# Altium project ublox_gnss_node.PrjPcb (part 2 of 3)

## Sheet USB_C_GNSS.SchDoc: Ublox GNSS Node
size A4; DocumentNumber: 9; SheetNumber: 9; SheetTotal: 12
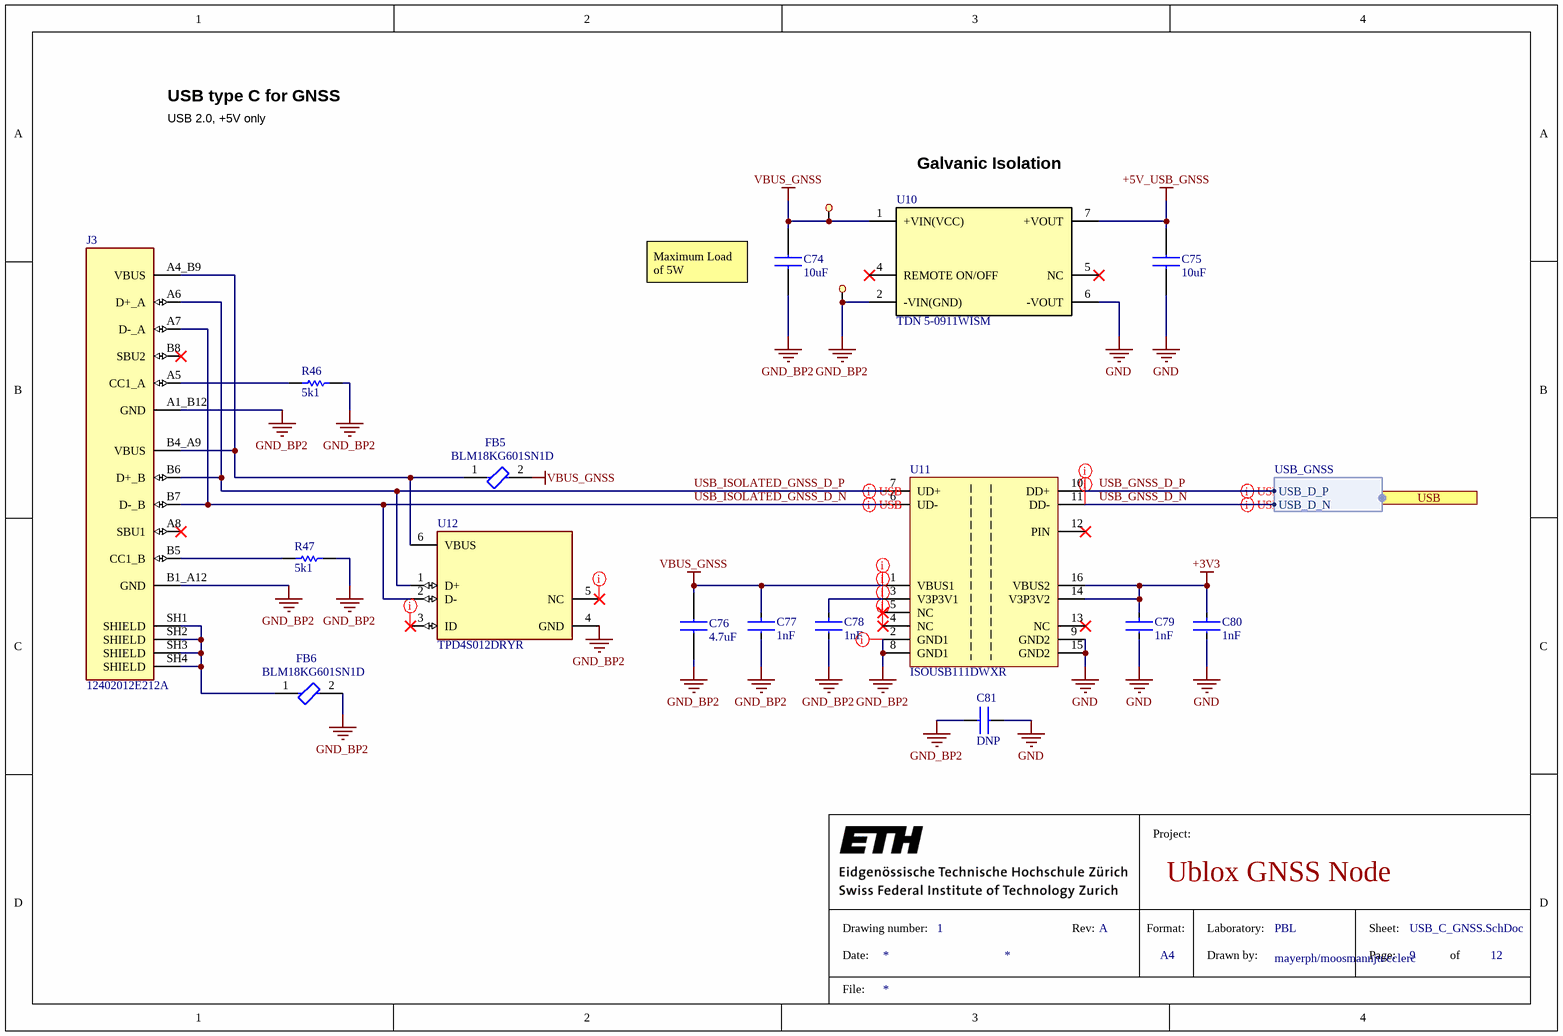
[diagram p4: USB_C_GNSS.SchDoc]

### Parts
*22  testpoint  [testpoint]  (value not drawn)
*24  testpoint  [testpoint]  (value not drawn)
C74  10uF  [CAPC2013X140N]
C75  10uF  [CAPC2013X140N]
C76  4.7uF  [CAPC1608X95N]
C77  1nF  [FP-C0805C-DN-MFG]
C78  1nF  [FP-C0805C-DN-MFG]
C79  1nF  [FP-C0805C-DN-MFG]
C80  1nF  [FP-C0805C-DN-MFG]
C81  DNP  [CAPC3216X180N]
FB5  BLM18KG601SN1D  [FP-BLM18-0_15-t0_8-IPC_A]
FB6  BLM18KG601SN1D  [FP-BLM18-0_15-t0_8-IPC_A]
J3  12402012E212A  [AMPHENOL_12402012E212A]
R46  5k1  [ERJUP6]
R47  5k1  [ERJUP6]
U10  TDN 5-0911WISM  [TDN 5WISM SINGLE_TRP]
U11  ISOUSB111DWXR  [DWX0016A]
U12  TPD4S012DRYR  [FP-DRY0006A-MFG]

### Ports
USB (harness USB_GNSS, see MAIN[6C], GNSS_ZED-X20P[1A])

### Harnesses
USB_GNSS: USB_D_P, USB_D_N

### Nets
+3V3: C79.1 C80.1 U11.14(V3P3V2) U11.16(VBUS2)
+5V_USB_GNSS: C75.2 U10.7(+VOUT)
GND: C75.1 C79.2 C80.2 C81.1 U10.6(-VOUT) U11.9(GND2) U11.15(GND2)
GND_BP2: *24.1 C74.1 C76.1 C77.2 C78.2 C81.2 FB6.2 J3.A1_B12(GND) J3.B1_A12(GND) R46.1 R47.1 U10.2(-VIN(GND)) U11.2(GND1) U11.8(GND1) U12.4(GND)
VBUS_GNSS: *22.1 C74.2 C76.2 C77.1 FB5.2 U10.1(+VIN(VCC)) U11.1(VBUS1)
USB_GNSS_D_N: U11.11(DD-) ; port USB.USB_D_N  [project net USB_D_N]
USB_GNSS_D_P: U11.10(DD+) ; port USB.USB_D_P  [project net USB_D_P]
USB_ISOLATED_GNSS_D_N: J3.A7(D-_A) J3.B7(D-_B) U11.6(UD-) U12.2(D-)
USB_ISOLATED_GNSS_D_P: J3.A6(D+_A) J3.B6(D+_B) U11.7(UD+) U12.1(D+)
NetC78_1: C78.1 U11.3(V3P3V1)
NetFB5_1: FB5.1 J3.A4_B9(VBUS) J3.B4_A9(VBUS) U12.6(VBUS)
NetFB6_1: FB6.1 J3.SH1(SHIELD) J3.SH2(SHIELD) J3.SH3(SHIELD) J3.SH4(SHIELD)
NetJ3_A5: J3.A5(CC1_A) R46.2
NetJ3_B5: J3.B5(CC1_B) R47.2

Not connected (* = marked no-connect by the designer): J3 A8(SBU1)* B8(SBU2)*; U10 4(REMOTE_ON/OFF)* 5(NC)*; U11 4(NC)* 5(NC)* 12(PIN)* 13(NC)*; U12 3(ID)* 5(NC)*

### Layout directives
net class USB_isolated: NetC78_1, NetU11_4, NetU11_5, NetU12_3, NetU12_5, VBUS_GNSS
mark named USB: GND_BP2
net class D90: USB_D_N, USB_D_P
differential pair; differential pair class USB_90R_isolated; rule Matched Net Lengths [Tolerance = 100mil]; net class USB_90R_isolated: USB_ISOLATED_GNSS_D_N, USB_ISOLATED_GNSS_D_P
differential pair; differential pair class USB_90R; rule Matched Net Lengths [Tolerance = 100mil]; net class USB_90R: USB_D_N, USB_D_P

### Notes on the sheet
- USB type C for GNSS
- USB 2.0, +5V only
- (near U10) Galvanic Isolation
- (near C74) Maximum Load of 5W
- Project:
- Drawing number:
- Date:
- 1
- Rev:
- Format:
- A4
- Laboratory:
- Drawn by:
- Sheet:
- Page:
- of
- File:

### Library data of the parts
C74 C75 = LMK212AB7106MG-T: Capacitor 10uF 0805; Manufacturer_Name: TAIYO YUDEN; Datasheet Link: https://datasheet.datasheetarchive.com/originals/distributors/Datasheets-DGA20/25674.pdf; Height: 1.4mm; Mouser Part Number: 963-LMK212AB7106MG-T; Mouser Price/Stock: https://www.mouser.co.uk/ProductDetail/Taiyo-Yuden/LMK212AB7106MG-T?qs=CNQs48zzdnrud19jlu61Cg%3D%3D; Manufacturer Part Number: LMK212AB7106MG-T; Supplier 1: Digikey; Supplier Part Number 1: 587-3417-1-ND
C76 = CL10B475KQ8NQNC: Capacitor 4.7uF 0603; Manufacturer_Name: SAMSUNG; Datasheet Link: https://datasheet.datasheetarchive.com/originals/distributors/Datasheets-DGA10/2410603.pdf; Height: 0.95mm; Manufacturer Part Number: CL10B475KQ8NQNC; Mouser Part Number: 187-CL10B475KQ8NQNC; Mouser Price/Stock: https://www.mouser.co.uk/ProductDetail/Samsung-Electro-Mechanics/CL10B475KQ8NQNC?qs=6tbHoouHnQxd6rcaSwpT7Q%3D%3D; Arrow Part Number: CL10B475KQ8NQNC; Arrow Price/Stock: https://www.arrow.com/en/products/cl10b475kq8nqnc/samsung-electro-mechanics; Supplier 1: Digikey; Supplier Part Number 1: 1276-2087-1-ND
C77-C80 = CMP-2007-00235-2: Capacitor 1nF 0805; Manufacturer: KEMET; Manufacturer Part Number: C0805C102J5GACTU; Value: 1,000 pF; Voltage Rating: 50 V; Temperature Characteristic: C0G; Material: Ceramic; Temperature Coefficient: 30ppm/°C; Tolerance: 0.05; Automotive: No; Device Class L1: Passive Components; Digikey Description: CAP CER 1000PF 50V C0G/NP0 0805; Lead Free: Yes; Capacitance: 1,000 pF; Package: C0805C-DN; RoHS: TRUE; Temperature Range High: +125°C; Height: 0.88mm; Ipc Land Pattern Name: CAPC200125X78; Category: Cap; ComponentLink2URL: https://content.kemet.com/datasheets/KEM_C1003_C0G_SMD.pdf; Device Class L2: Capacitors; ComponentLink2Description: Datasheet; Temperature: -55°C to +125°C; Octopart: https://octopart.com/c0805c102j5gactu-kemet-97757; Mouser Description: Multilayer Ceramic Capacitors MLCC - SMD/SMT 50volts 1000pF C0G 5%; Device Class L3: Ceramic Capacitors; Temperature Range Low: -55°C; Supplier 1: Mouser; Supplier Part Number 1: 80-C0805C102J5G
C81 = CL31B102KJHNNNE: Capacitor 1nF/2kV 3216 Isolated GND Loop Cap; Manufacturer_Name: SAMSUNG; Datasheet Link: https://www.tme.com/Document/4a42202b32dab16128fe107dd69598cc/samsung-chip-cap.pdf; Height: 1.8mm; Manufacturer Part Number: CL31B102KJHNNNE; Mouser Part Number: 187-CL31B102KJHNNNE; Mouser Price/Stock: https://www.mouser.co.uk/ProductDetail/Samsung-Electro-Mechanics/CL31B102KJHNNNE?qs=X6jEic%2FHinAYVHtIjHgytw%3D%3D; Arrow Part Number: CL31B102KJHNNNE; Arrow Price/Stock: https://www.arrow.com/en/products/cl31b102kjhnnne/samsung-electro-mechanics?utm_currency=USD&region=nac; Supplier 1: DigiKey; Supplier Part Number 1: 1276-3073-1-ND
FB5 FB6 = CMP-0686-00581-3: Chip Ferrite Bead, 0603, 600Ω @ 100MHz, 0.15Ω, 25%, 1.3A; Material: Steel; Number of Lines: 1; Impedance: 600R; DC Resistance (DCR): 150mR; Tolerance: 25%; Case Code (Metric): 1608; Width: 0.8mm; DC Current: 1.3A; Max DC Current: 1.3A; Package Quantity: 1; Number of Pins: 2; Military Standard: Not; RoHS Compliant: Yes; Termination: SMD/SMT; Max Operating Temperature: 125°C; Length: 1.6mm; Depth: 0.8mm; Case Code (Imperial): 0603; Series: BLM18K; Inductor Type: FERRITE BEAD; Core Material: Ferrite; Number of Circuits: 1; Height: 0.8mm; Case/Package: 0603; REACH SVHC: No SVHC; Packaging: Tape and Reel; Min Operating Temperature: -55°C; Max Current Rating: 1.3A; Radiation Hardening: No; Current Rating: 1.3A; Lead Free: Lead Free; Test Frequency: 100MHz; Weight: 7.1E-05oz
J3 = 12402012E212A: USB2.0, Type C, Top mount, CH 1.68mm, Dual Row SMT; MF: Amphenol ICC (Commercial Products); MP: 12402012E212A; Price: None; Package: None; Availability: In Stock; SnapEDA_Link: https://www.snapeda.com/parts/12402012E212A/Amphenol/view-part/?ref=snap; Value: *; Check_prices: https://www.snapeda.com/parts/12402012E212A/Amphenol/view-part/?ref=eda; Purchase-URL: https://pricing.snapeda.com/search/part/12402012E212A/?ref=eda; Manufacturer Part Number: 12402012E212A; Supplier 1: Digikey; Supplier Part Number 1: 664-12402012E212ACT-ND
R46 R47 = ERJ-UP6D5101V: Resistor 5k1 0805; Manufacturer_Name: Panasonic; Datasheet Link: https://industrial.panasonic.com/cdbs/www-data/pdf/RDP0000/AOA0000C337.pdf; Height: 0.7mm; Mouser Part Number: 667-ERJ-UP6D5101V; Mouser Price/Stock: https://www.mouser.co.uk/ProductDetail/Panasonic/ERJ-UP6D5101V?qs=ZcfC38r4Pouz7%2FLHthUDHQ%3D%3D; Arrow Part Number: ERJ-UP6D5101V; Arrow Price/Stock: https://www.arrow.com/en/products/erj-up6d5101v/panasonic?utm_currency=USD&region=nac; Supplier 1: Mouser; Supplier Part Number 1: 667-ERJ-UP6D5101V; Manufacturer Part Number: ERJ-UP6D5101V
U10 = TDN 5-0911WISM: TDN 5-0911WISM DC-DC Converter, 5V, 1A; No. of Outputs: 1 Output; Output Power Max: 5W; Voltage - 1: 5V; Current 1: 1A;; NexarPartId: 76519263; Number of Outputs: 1; RoHS: Compliant; Output Power: 5W; Width: 9.1mm; Height: 10.2mm; Supplier: DigiKey; Supplier Part Number: TDN5-0911WISM-ND
U11 = ISOUSB111DWXR: Low emissions, full and low speed isolated USB repeater 16-SSOP -40 to 125; Manufacturer: Texas Instruments; Supplier: Digikey; Supplier Part Number: 296-ISOUSB111DWXRCT-ND; Manufacturer Part Number: ISOUSB111DWXR; RoHS: No; Stock: 317; Pricing: 1=10.29, 10=9.294, 25=8.8616, 100=7.6946, 250=7.34876, 500=6.70034 (USD); Supplier 1: Digikey; Supplier Part Number 1: 296-ISOUSB111DWXRCT-ND
U12 = CMP-0326-00038-4: TVS DIODE 5.5V 6SON; Breakdown Voltage: 24V; Interface: USB; ESD Protection: Yes; Peak Pulse Power: 60W; Number of Circuits: 4; Polarity: Unidirectional; Capacitance: 15pF; Test Current: 1mA; Working Voltage: 19V; Min Breakdown Voltage: 6V; Peak Pulse Current: 3A; Operating Supply Voltage: 950mV; Max Operating Temperature: 85°C; Packaging: Tape and Reel; Termination: SMD/SMT; Number of Pins: 6; Radiation Hardening: No; Width: 1.05mm; REACH SVHC: No SVHC; Lead Free: Lead Free; Depth: 1mm; Package Quantity: 5000; Length: 1.45mm; Direction: Unidirectional; Min Operating Temperature: -40°C; Number of Channels: 4; Max Power Dissipation: 60W; Height: 0.55mm; Manufacturer Part Number: TPD4S012DRYR

## Sheet USB_C_MCU.SchDoc: Ublox GNSS Node
size A4; DocumentNumber: 8; SheetNumber: 8; SheetTotal: 12
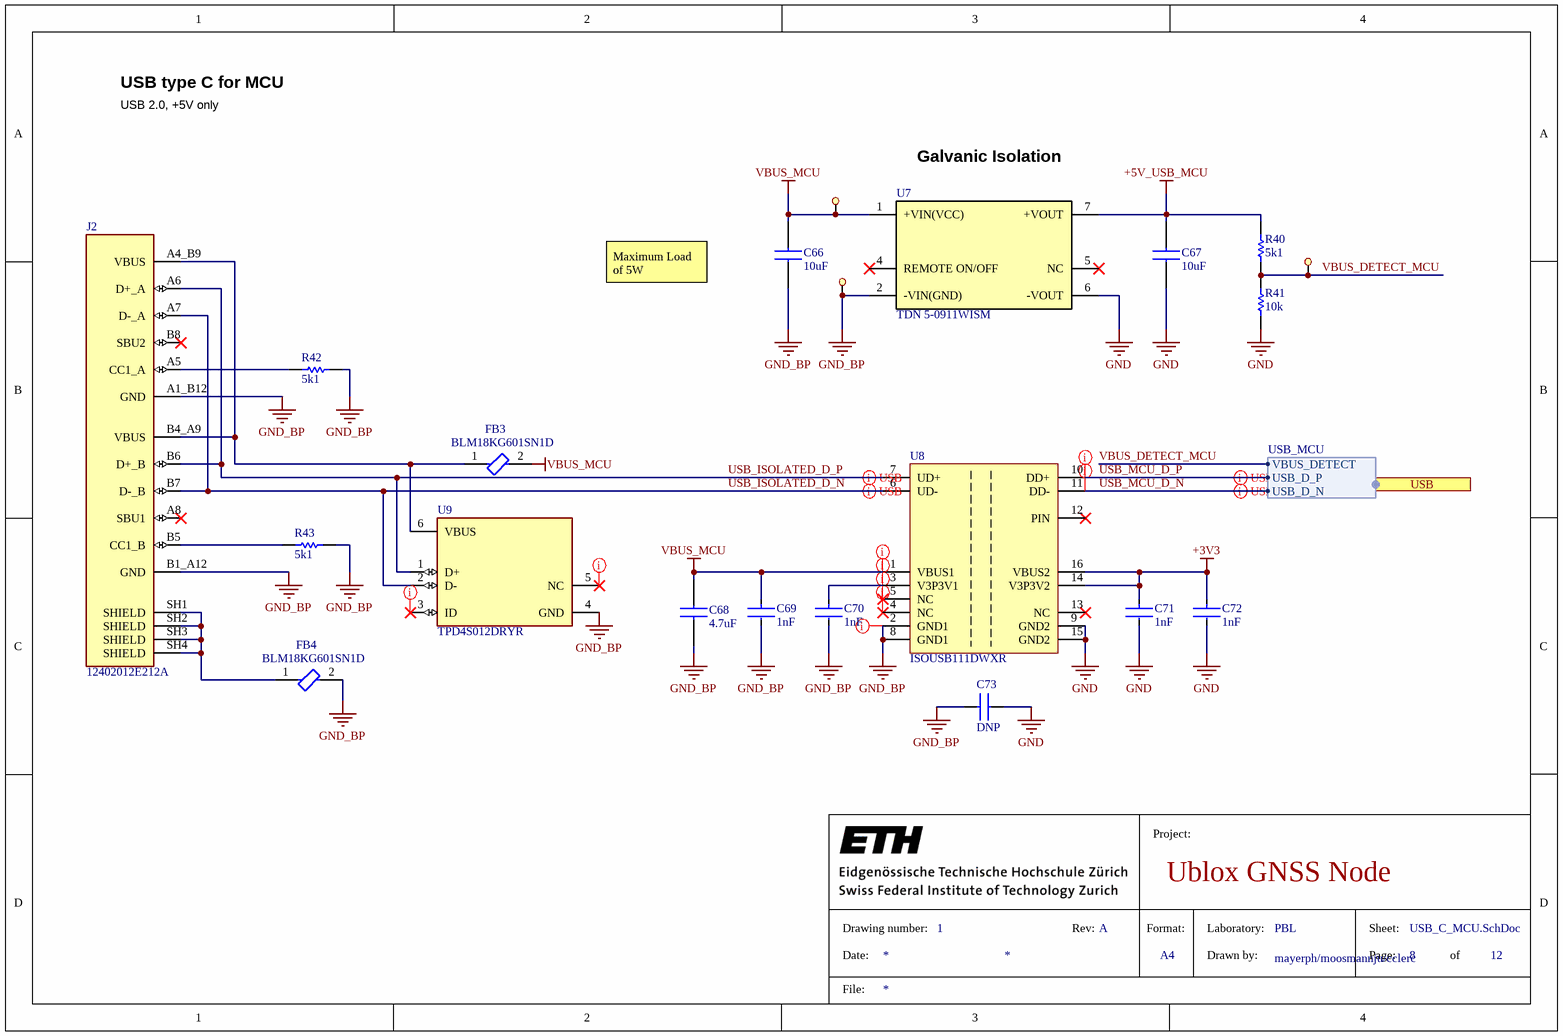
[diagram p5: USB_C_MCU.SchDoc]

### Parts
*19  testpoint  [testpoint]  (value not drawn)
*20  testpoint  [testpoint]  (value not drawn)
*21  testpoint  [testpoint]  (value not drawn)
C66  10uF  [CAPC2013X140N]
C67  10uF  [CAPC2013X140N]
C68  4.7uF  [CAPC1608X95N]
C69  1nF  [FP-C0805C-DN-MFG]
C70  1nF  [FP-C0805C-DN-MFG]
C71  1nF  [FP-C0805C-DN-MFG]
C72  1nF  [FP-C0805C-DN-MFG]
C73  DNP  [CAPC3216X180N]
FB3  BLM18KG601SN1D  [FP-BLM18-0_15-t0_8-IPC_A]
FB4  BLM18KG601SN1D  [FP-BLM18-0_15-t0_8-IPC_A]
J2  12402012E212A  [AMPHENOL_12402012E212A]
R40  5k1  [ERJUP6]
R41  10k  [RESC1005X40X25ML05T05]
R42  5k1  [ERJUP6]
R43  5k1  [ERJUP6]
U7  TDN 5-0911WISM  [TDN 5WISM SINGLE_TRP]
U8  ISOUSB111DWXR  [DWX0016A]
U9  TPD4S012DRYR  [FP-DRY0006A-MFG]

### Ports
USB (harness USB_MCU, see MAIN[6C], MCU[1A])

### Harnesses
USB_MCU: USB_D_P, USB_D_N, VBUS_DETECT

### Nets
+3V3: C71.1 C72.1 U8.14(V3P3V2) U8.16(VBUS2)
+5V_USB_MCU: C67.2 R40.1 U7.7(+VOUT)
GND: C67.1 C71.2 C72.2 C73.1 R41.1 U7.6(-VOUT) U8.9(GND2) U8.15(GND2)
GND_BP: *21.1 C66.1 C68.1 C69.2 C70.2 C73.2 FB4.2 J2.A1_B12(GND) J2.B1_A12(GND) R42.1 R43.1 U7.2(-VIN(GND)) U8.2(GND1) U8.8(GND1) U9.4(GND)
VBUS_MCU: *19.1 C66.2 C68.2 C69.1 FB3.2 U7.1(+VIN(VCC)) U8.1(VBUS1)
USB_ISOLATED_D_N: J2.A7(D-_A) J2.B7(D-_B) U8.6(UD-) U9.2(D-)
USB_ISOLATED_D_P: J2.A6(D+_A) J2.B6(D+_B) U8.7(UD+) U9.1(D+)
USB_MCU_D_N: U8.11(DD-) ; port USB.USB_D_N
USB_MCU_D_P: U8.10(DD+) ; port USB.USB_D_P
VBUS_DETECT_MCU: *20.1 R40.2 R41.2 ; port USB.VBUS_DETECT
NetC70_1: C70.1 U8.3(V3P3V1)
NetFB3_1: FB3.1 J2.A4_B9(VBUS) J2.B4_A9(VBUS) U9.6(VBUS)
NetFB4_1: FB4.1 J2.SH1(SHIELD) J2.SH2(SHIELD) J2.SH3(SHIELD) J2.SH4(SHIELD)
NetJ2_A5: J2.A5(CC1_A) R42.2
NetJ2_B5: J2.B5(CC1_B) R43.2

Not connected (* = marked no-connect by the designer): J2 A8(SBU1)* B8(SBU2)*; U7 4(REMOTE_ON/OFF)* 5(NC)*; U8 4(NC)* 5(NC)* 12(PIN)* 13(NC)*; U9 3(ID)* 5(NC)*

### Layout directives
net class USB_isolated: NetC70_1, NetU8_4, NetU8_5, NetU9_3, NetU9_5, VBUS_MCU
mark named USB: GND_BP
net class D90: USB_MCU_D_N, USB_MCU_D_P
differential pair; differential pair class USB_90R_isolated; rule Matched Net Lengths [Tolerance = 100mil]; net class USB_90R_isolated: USB_ISOLATED_D_N, USB_ISOLATED_D_P
differential pair; differential pair class USB_90R; rule Matched Net Lengths [Tolerance = 100mil]; net class USB_90R: USB_MCU_D_N, USB_MCU_D_P

### Notes on the sheet
- USB type C for MCU
- USB 2.0, +5V only
- (near U7) Galvanic Isolation
- Maximum Load of 5W
- Project:
- Drawing number:
- Date:
- 1
- Rev:
- Format:
- A4
- Laboratory:
- Drawn by:
- Sheet:
- Page:
- of
- File:

### Library data of the parts
C66 C67 = LMK212AB7106MG-T: as C74 on sheet USB_C_GNSS; Datasheet Link: https://datasheet.datasheetarchive.com/originals/distributors/Datasheets-DGA20/25674.pdf; Height: 1.4mm; Mouser Part Number: 963-LMK212AB7106MG-T; Mouser Price/Stock: https://www.mouser.co.uk/ProductDetail/Taiyo-Yuden/LMK212AB7106MG-T?qs=CNQs48zzdnrud19jlu61Cg%3D%3D; Manufacturer Part Number: LMK212AB7106MG-T; Supplier 1: Digikey; Supplier Part Number 1: 587-3417-1-ND
C68 = CL10B475KQ8NQNC: as C76 on sheet USB_C_GNSS; Datasheet Link: https://datasheet.datasheetarchive.com/originals/distributors/Datasheets-DGA10/2410603.pdf; Height: 0.95mm; Manufacturer Part Number: CL10B475KQ8NQNC; Mouser Part Number: 187-CL10B475KQ8NQNC; Mouser Price/Stock: https://www.mouser.co.uk/ProductDetail/Samsung-Electro-Mechanics/CL10B475KQ8NQNC?qs=6tbHoouHnQxd6rcaSwpT7Q%3D%3D; Arrow Part Number: CL10B475KQ8NQNC; Arrow Price/Stock: https://www.arrow.com/en/products/cl10b475kq8nqnc/samsung-electro-mechanics; Supplier 1: Digikey; Supplier Part Number 1: 1276-2087-1-ND
C69-C72 = CMP-2007-00235-2: as C77 on sheet USB_C_GNSS; Automotive: No; Device Class L1: Passive Components; Digikey Description: CAP CER 1000PF 50V C0G/NP0 0805; Lead Free: Yes; Capacitance: 1,000 pF; Package: C0805C-DN; RoHS: TRUE; Temperature Range High: +125°C; Height: 0.88mm; Ipc Land Pattern Name: CAPC200125X78; Category: Cap; ComponentLink2URL: https://content.kemet.com/datasheets/KEM_C1003_C0G_SMD.pdf; Device Class L2: Capacitors; ComponentLink2Description: Datasheet; Temperature: -55°C to +125°C; Octopart: https://octopart.com/c0805c102j5gactu-kemet-97757; Mouser Description: Multilayer Ceramic Capacitors MLCC - SMD/SMT 50volts 1000pF C0G 5%; Device Class L3: Ceramic Capacitors; Temperature Range Low: -55°C; Supplier 1: Mouser; Supplier Part Number 1: 80-C0805C102J5G
C73 = CL31B102KJHNNNE: as C81 on sheet USB_C_GNSS; Datasheet Link: https://www.tme.com/Document/4a42202b32dab16128fe107dd69598cc/samsung-chip-cap.pdf; Height: 1.8mm; Manufacturer Part Number: CL31B102KJHNNNE; Mouser Part Number: 187-CL31B102KJHNNNE; Mouser Price/Stock: https://www.mouser.co.uk/ProductDetail/Samsung-Electro-Mechanics/CL31B102KJHNNNE?qs=X6jEic%2FHinAYVHtIjHgytw%3D%3D; Arrow Part Number: CL31B102KJHNNNE; Arrow Price/Stock: https://www.arrow.com/en/products/cl31b102kjhnnne/samsung-electro-mechanics?utm_currency=USD&region=nac; Supplier 1: DigiKey; Supplier Part Number 1: 1276-3073-1-ND
FB3 FB4 = CMP-0686-00581-3: as FB5 on sheet USB_C_GNSS; Tolerance: 25%; Case Code (Metric): 1608; Width: 0.8mm; DC Current: 1.3A; Max DC Current: 1.3A; Package Quantity: 1; Number of Pins: 2; Military Standard: Not; RoHS Compliant: Yes; Termination: SMD/SMT; Max Operating Temperature: 125°C; Length: 1.6mm; Depth: 0.8mm; Case Code (Imperial): 0603; Series: BLM18K; Inductor Type: FERRITE BEAD; Core Material: Ferrite; Number of Circuits: 1; Height: 0.8mm; Case/Package: 0603; REACH SVHC: No SVHC; Packaging: Tape and Reel; Min Operating Temperature: -55°C; Max Current Rating: 1.3A; Radiation Hardening: No; Current Rating: 1.3A; Lead Free: Lead Free; Test Frequency: 100MHz; Weight: 7.1E-05oz
J2 = 12402012E212A: as J3 on sheet USB_C_GNSS; MP: 12402012E212A; Price: None; Package: None; Availability: In Stock; SnapEDA_Link: https://www.snapeda.com/parts/12402012E212A/Amphenol/view-part/?ref=snap; Value: *; Check_prices: https://www.snapeda.com/parts/12402012E212A/Amphenol/view-part/?ref=eda; Purchase-URL: https://pricing.snapeda.com/search/part/12402012E212A/?ref=eda; Manufacturer Part Number: 12402012E212A; Supplier 1: Digikey; Supplier Part Number 1: 664-12402012E212ACT-ND
R40 R42 R43 = ERJ-UP6D5101V: as R46 on sheet USB_C_GNSS; Datasheet Link: https://industrial.panasonic.com/cdbs/www-data/pdf/RDP0000/AOA0000C337.pdf; Height: 0.7mm; Mouser Part Number: 667-ERJ-UP6D5101V; Mouser Price/Stock: https://www.mouser.co.uk/ProductDetail/Panasonic/ERJ-UP6D5101V?qs=ZcfC38r4Pouz7%2FLHthUDHQ%3D%3D; Arrow Part Number: ERJ-UP6D5101V; Arrow Price/Stock: https://www.arrow.com/en/products/erj-up6d5101v/panasonic?utm_currency=USD&region=nac; Supplier 1: Mouser; Supplier Part Number 1: 667-ERJ-UP6D5101V; Manufacturer Part Number: ERJ-UP6D5101V
R41 = CMP-2002-00433-1: Resistor 10k 0402; Manufacturer Part Number: ERJ-2GEJ103X; Manufacturer: Panasonic; Supplier 1: Mouser; Supplier Part Number 1: 667-ERJ-2GEJ103X
U7 = TDN 5-0911WISM: as U10 on sheet USB_C_GNSS; RoHS: Compliant; Output Power: 5W; Width: 9.1mm; Height: 10.2mm; Supplier: DigiKey; Supplier Part Number: TDN5-0911WISM-ND
U8 = ISOUSB111DWXR: as U11 on sheet USB_C_GNSS; Supplier: Digikey; Supplier Part Number: 296-ISOUSB111DWXRCT-ND; Manufacturer Part Number: ISOUSB111DWXR; RoHS: No; Stock: 317; Pricing: 1=10.29, 10=9.294, 25=8.8616, 100=7.6946, 250=7.34876, 500=6.70034 (USD); Supplier 1: Digikey; Supplier Part Number 1: 296-ISOUSB111DWXRCT-ND
U9 = CMP-0326-00038-4: as U12 on sheet USB_C_GNSS; Max Operating Temperature: 85°C; Packaging: Tape and Reel; Termination: SMD/SMT; Number of Pins: 6; Radiation Hardening: No; Width: 1.05mm; REACH SVHC: No SVHC; Lead Free: Lead Free; Depth: 1mm; Package Quantity: 5000; Length: 1.45mm; Direction: Unidirectional; Min Operating Temperature: -40°C; Number of Channels: 4; Max Power Dissipation: 60W; Height: 0.55mm; Manufacturer Part Number: TPD4S012DRYR

## Sheet ETH.SchDoc: Ublox GNSS Node
size A3; DocumentNumber: 6; SheetNumber: 6; SheetTotal: 12
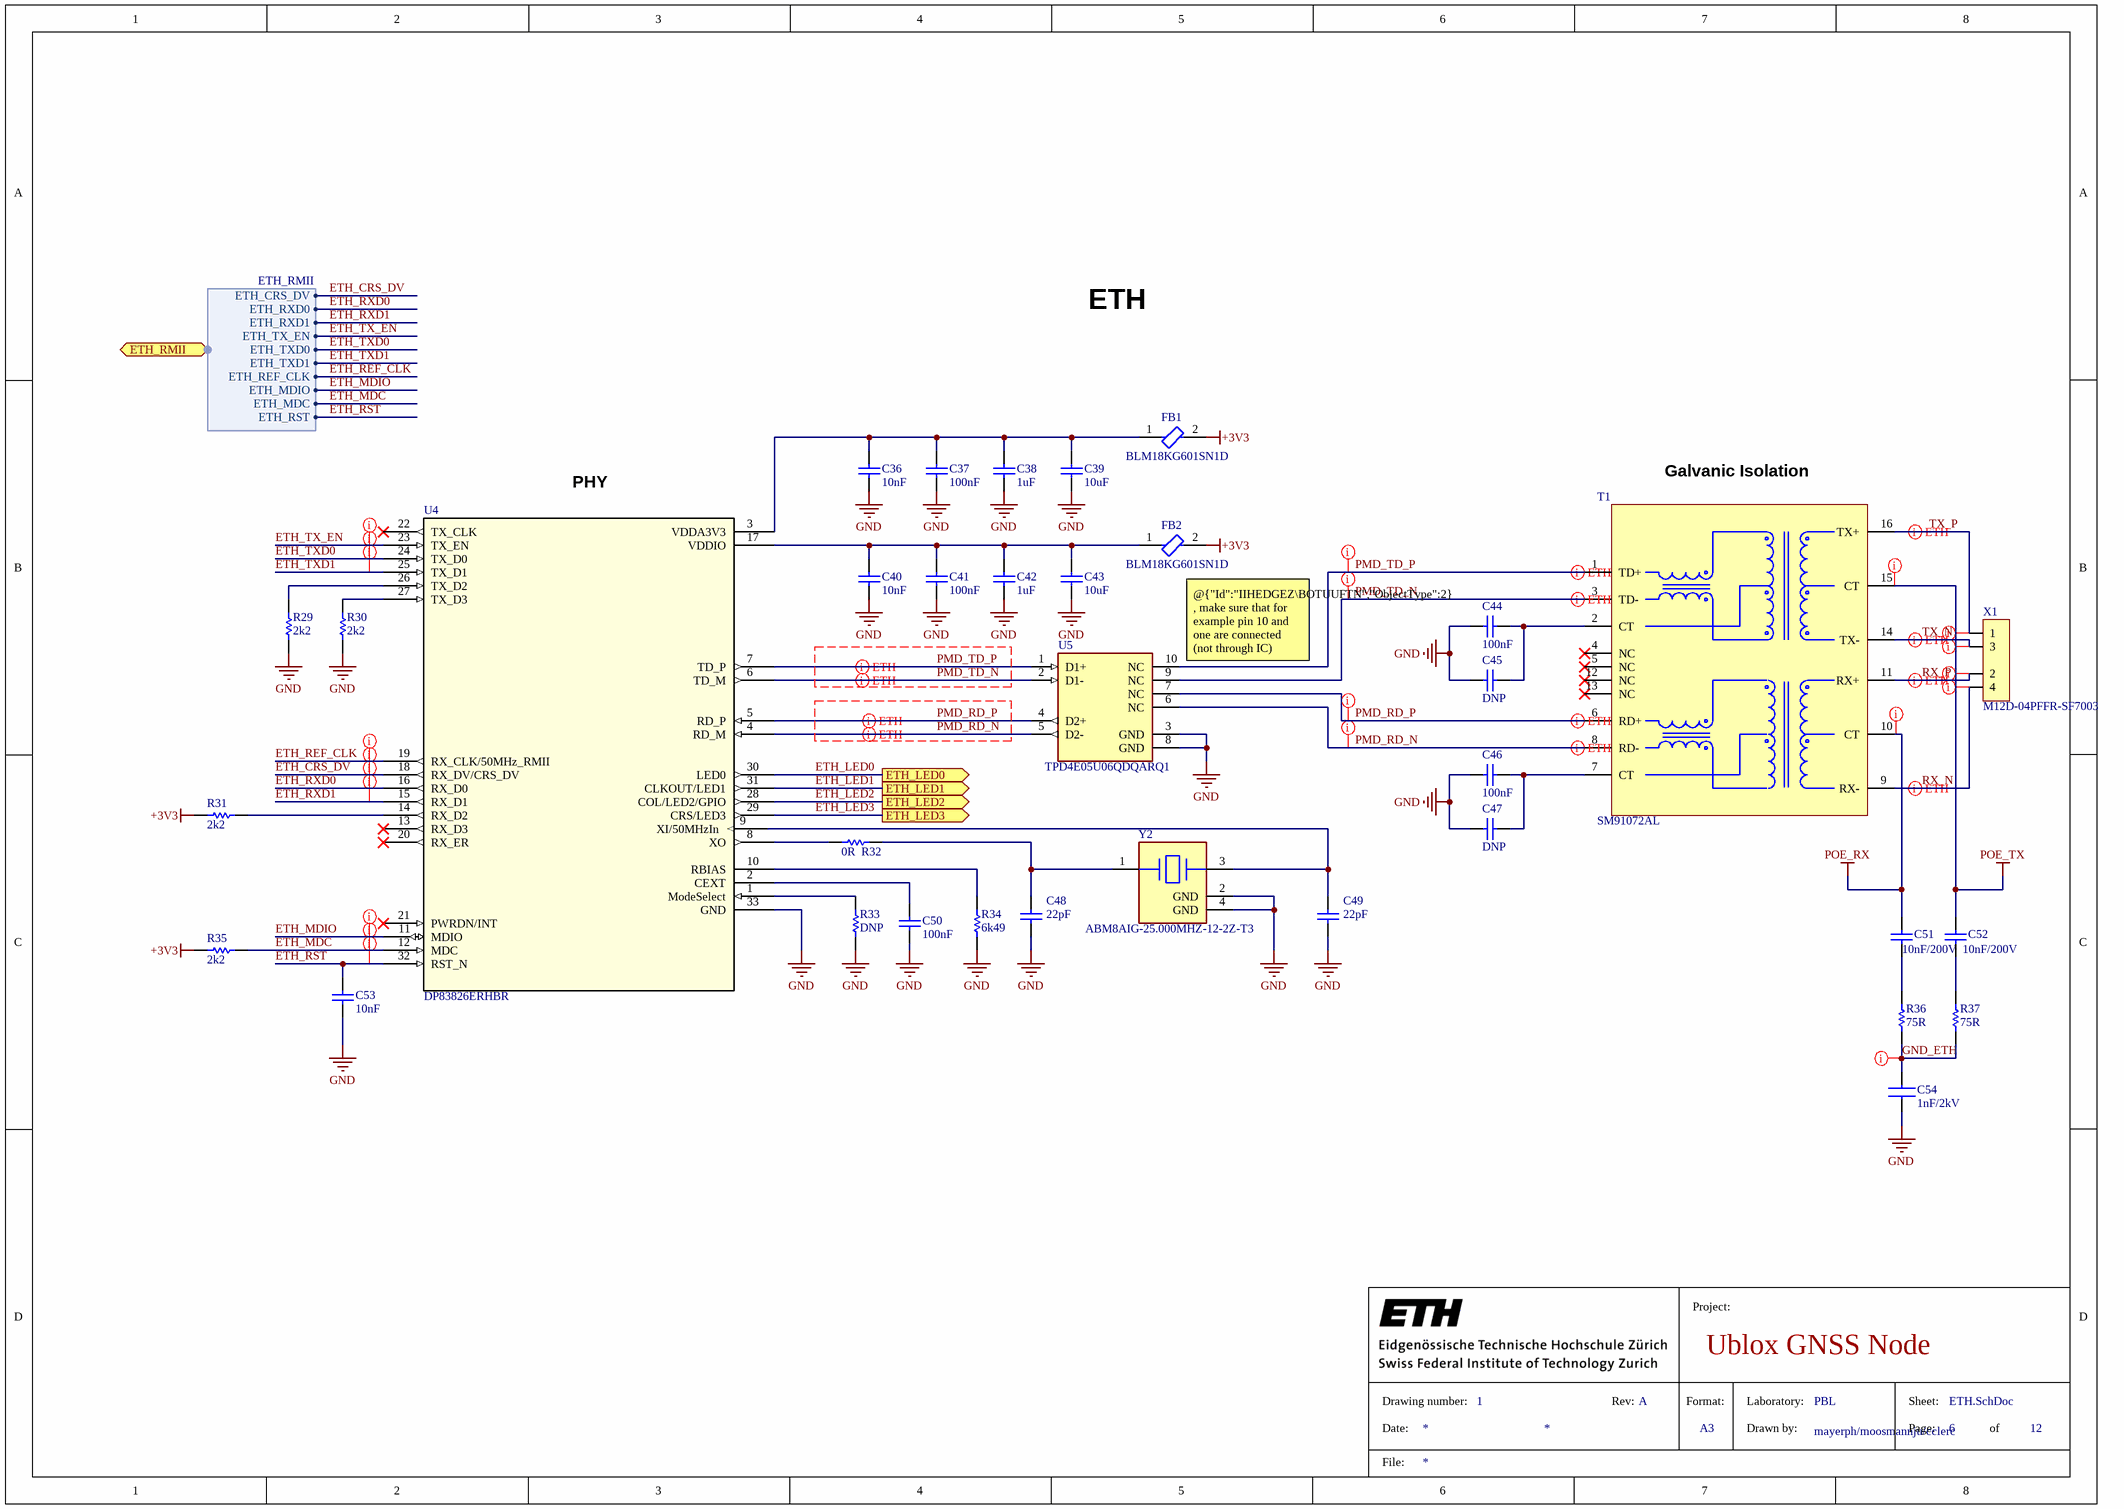
[diagram p6: ETH.SchDoc]

### Parts
C36  10nF  [GRM15x]
C37  100nF  [CAPC1005X55X25LL05T10]
C38  1uF  [CAPC1005X70N]
C39  10uF  [GRM15x]
C40  10nF  [GRM15x]
C41  100nF  [CAPC1005X55X25LL05T10]
C42  1uF  [CAPC1005X70N]
C43  10uF  [GRM15x]
C44  100nF  [CAPC1005X55X25LL05T10]
C45  DNP  [CAPC1005X55X25LL05T10]
C46  100nF  [CAPC1005X55X25LL05T10]
C47  DNP  [CAPC1005X55X25LL05T10]
C48  22pF  [C0402C104J4RACTU]
C49  22pF  [C0402C104J4RACTU]
C50  100nF  [CAPC1005X55X25LL05T10]
C51  10nF/200V  [CAPC0603(1608)100_L]
C52  10nF/200V  [CAPC0603(1608)100_L]
C53  10nF  [GRM15x]
C54  1nF/2kV  [CAPC3216X180N]
FB1  BLM18KG601SN1D  [FP-BLM18-0_15-t0_8-IPC_A]
FB2  BLM18KG601SN1D  [FP-BLM18-0_15-t0_8-IPC_A]
R29  2k2  [RESC2013X60X40LL20T25]
R30  2k2  [RESC2013X60X40LL20T25]
R31  2k2  [RESC2013X60X40LL20T25]
R32  0R  [RESC1005X40X25NL05T10]
R33  DNP  [RESC1005X40X25NL05T10]
R34  6k49  [RESC1005X40X25NL05T05]
R35  2k2  [RESC2013X60X40LL20T25]
R36  75R  [RESC2013X60X40NL20T25]
R37  75R  [RESC2013X60X40NL20T25]
T1  SM91072AL  [SOIC127P950X590-16N]
U4  DP83826ERHBR  [QFN_ERHBR_TEX]
U5  TPD4E05U06QDQARQ1  [FP-DQA0010A-MFG]
X1  M12D-04PFFR-SF7003  [M12D04PFFRSF7003]
Y2  ABM8AIG-25.000MHZ-12-2Z-T3  [FP-ABM8AIG-MFG]

### Ports
ETH_LED0 (out, see MAIN[3C], IndicatorLEDs[1A]), ETH_LED1 (out, see MAIN[3C], IndicatorLEDs[1A]), ETH_LED2 (out, see MAIN[3C], IndicatorLEDs[1B]), ETH_LED3 (out, see MAIN[3C], IndicatorLEDs[1B]), ETH_RMII (bidir, harness ETH_RMII, see MAIN[3C], MCU[1A])

### Harnesses
ETH_RMII: ETH_REF_CLK, ETH_MDIO, ETH_MDC, ETH_CRS_DV, ETH_TX_EN, ETH_RXD0, ETH_RXD1, ETH_TXD0, ETH_TXD1, ETH_RST

### Nets
+3V3: FB1.2 FB2.2 R31.1 R35.2
GND: C36.1 C37.1 C38.1 C39.1 C40.1 C41.1 C42.1 C43.1 C44.1 C45.1 C46.1 C47.1 C48.1 C49.1 C50.1 C53.1 C54.1 R29.1 R30.1 R33.1 R34.1 U4.33(GND) U5.3(GND) U5.8(GND) Y2.2(GND) Y2.4(GND)
POE_RX: C51.1 T1.10(CT)
POE_TX: C52.1 T1.15(CT)
ETH_CRS_DV: U4.18(RX_DV/CRS_DV) ; port ETH_RMII.ETH_CRS_DV
ETH_LED0: U4.30(LED0) ; port ETH_LED0
ETH_LED1: U4.31(CLKOUT/LED1) ; port ETH_LED1
ETH_LED2: U4.28(COL/LED2/GPIO) ; port ETH_LED2
ETH_LED3: U4.29(CRS/LED3) ; port ETH_LED3
ETH_MDC: R35.1 U4.12(MDC) ; port ETH_RMII.ETH_MDC
ETH_MDIO: U4.11(MDIO) ; port ETH_RMII.ETH_MDIO
ETH_REF_CLK: U4.19(RX_CLK/50MHz_RMII) ; port ETH_RMII.ETH_REF_CLK
ETH_RST: C53.2 U4.32(RST_N) ; port ETH_RMII.ETH_RST
ETH_RXD0: U4.16(RX_D0) ; port ETH_RMII.ETH_RXD0
ETH_RXD1: U4.15(RX_D1) ; port ETH_RMII.ETH_RXD1
ETH_TX_EN: U4.23(TX_EN) ; port ETH_RMII.ETH_TX_EN
ETH_TXD0: U4.24(TX_D0) ; port ETH_RMII.ETH_TXD0
ETH_TXD1: U4.25(TX_D1) ; port ETH_RMII.ETH_TXD1
GND_ETH: C54.2 R36.1 R37.1
PMD_RD_N: T1.8(RD-) U4.4(RD_M) U5.5(D2-) U5.6(NC)
PMD_RD_P: T1.6(RD+) U4.5(RD_P) U5.4(D2+) U5.7(NC)
PMD_TD_N: T1.3(TD-) U4.6(TD_M) U5.2(D1-) U5.9(NC)
PMD_TD_P: T1.1(TD+) U4.7(TD_P) U5.1(D1+) U5.10(NC)
RX_N: T1.9(RX-) X1.4
RX_P: T1.11(RX+) X1.2
TX_N: T1.14(TX-) X1.3
TX_P: T1.16(TX+) X1.1
NetC36_2: C36.2 C37.2 C38.2 C39.2 FB1.1 U4.3(VDDA3V3)
NetC40_2: C40.2 C41.2 C42.2 C43.2 FB2.1 U4.17(VDDIO)
NetC44_2: C44.2 C45.2 T1.2(CT)
NetC46_2: C46.2 C47.2 T1.7(CT)
NetC48_2: C48.2 R32.2 Y2.1
NetC49_2: C49.2 U4.9(XI/50MHzIn) Y2.3
NetC50_2: C50.2 U4.2(CEXT)
NetC51_2: C51.2 R36.2
NetC52_2: C52.2 R37.2
NetR29_2: R29.2 U4.26(TX_D2)
NetR30_2: R30.2 U4.27(TX_D3)
NetR31_2: R31.2 U4.14(RX_D2)
NetR32_1: R32.1 U4.8(XO)
NetR33_2: R33.2 U4.1(ModeSelect)
NetR34_2: R34.2 U4.10(RBIAS)

Not connected (* = marked no-connect by the designer): T1 4(NC)* 5(NC)* 12(NC)* 13(NC)*; U4 13(RX_D3)* 20(RX_ER)* 21(PWRDN/INT)* 22(TX_CLK)*

### Layout directives
differential pair; differential pair class ETH_100R_isolated; rule Matched Net Lengths [Tolerance = 100mil]: RX_N, RX_P, TX_N, TX_P
net class ETH_isolated: GND_ETH, POE_RX, POE_TX, RX_N, RX_P, TX_N, TX_P
net class ETH: PMD_RD_N, PMD_RD_P, PMD_TD_N, PMD_TD_P
differential pair; differential pair class ETH_100R; rule Matched Net Lengths [Tolerance = 100mil]: PMD_RD_N, PMD_RD_P, PMD_TD_N, PMD_TD_P
differential pair; differential pair class ETH_100R; net class ETH_100R; rule Matched Net Lengths [Tolerance = 100mil]: PMD_RD_N, PMD_RD_P, PMD_TD_N, PMD_TD_P
net class 50RNetsClass: ETH_CRS_DV, ETH_MDC, ETH_MDIO, ETH_REF_CLK, ETH_RST, ETH_RXD0, ETH_RXD1, ETH_TX_EN, ETH_TXD0, ETH_TXD1

### Notes on the sheet
- ETH
- (near U4) PHY
- (near T1) Galvanic Isolation
- @{"Id":"IIHEDGEZ\BOTUUFTN","ObjectType":2} , make sure that for example pin 10 and one are connected (not through IC)
- Project:
- Drawing number:
- Date:
- 1
- Rev:
- Format:
- A3
- Laboratory:
- Drawn by:
- Sheet:
- Page:
- of
- File:

### Library data of the parts
C36 C40 C53 = GRM155R71H103KA88D: Capacitor 10nF/50V 0402 - storage; Manufacturer_Name: Murata Electronics; Datasheet Link: https://search.murata.co.jp/Ceramy/image/img/A01X/G101/ENG/GRM155R71H103KA88-01A.pdf; Height: 0.33mm; Manufacturer Part Number: GRM155R71H103KA88D; Mouser Part Number: 81-GRM155R71H103KA8D; Mouser Price/Stock: https://www.mouser.co.uk/ProductDetail/Murata-Electronics/GRM155R71H103KA88D?qs=Dfh4SrgScWxOVlCuzd3ZyQ%3D%3D; Arrow Part Number: GRM155R71H103KA88D; Arrow Price/Stock: https://www.arrow.com/en/products/grm155r71h103ka88d/murata-manufacturing?utm_currency=USD&region=nac
C37 C41 C44-C47 C50 = GRM155R71H104KE14J: Capacitor 100nF 0402 - storage; Manufacturer: Murata; Tolerance: 10%; Dielectric: X7R; Voltage Rating (DC): 50V; Supplier 1: Digi-Key; Manufacturer Part Number: GRM155R71H104KE14J; RoHS: Yes; Category: Ceramic Capacitors; Stock 1: 1916144; Pricing 1: 1=0.10000, 10=0.03800, 100=0.01680, 500=0.01198, 1000=0.00941, 2500=0.00855, 5000=0.00787 (USD); Mount: Surface Mount; Case/Package: 0402; Weight: 0.000212oz; Case Code (Imperial): 0402; Case Code (Metric): 1005; Min Operating Temperature: -55°C; Max Operating Temperature: 125°C; Termination: SMD/SMT; Composition: Ceramic; Package Quantity: 50000; Packaging: Tape and Reel; Value: 100nF; Voltage Rating: 50V; Length: 0.039inch; Height: 0.5mm; Width: 0.5mm; Thickness: 0.022inch; Lead Free: Lead Free; ComponentLink1URL: http://search.murata.co.jp/Ceramy/image/img/A01X/G101/ENG/GRM155R71H104KE14-01.pdf?src-supplier=Mouser; ComponentLink1Description: http://search.murata.co.jp/Ceramy/image/img/A01X/G101/ENG/GRM155R71H104KE14-01.pdf?src-supplier=Mouser; ComponentLink2URL: http://search.murata.co.jp/Ceramy/image/img/A01X/G101/ENG/GRM155R71H104KE14-01.pdf?src-supplier=Digi-Key; ComponentLink2Description: http://search.murata.co.jp/Ceramy/image/img/A01X/G101/ENG/GRM155R71H104KE14-01.pdf?src-supplier=Digi-Key; ComponentLink3URL: http://search.murata.co.jp/Ceramy/image/img/A01X/G101/ENG/GRM155R71H104KE14-01.pdf?src-supplier=Avnet; ComponentLink3Description: http://search.murata.co.jp/Ceramy/image/img/A01X/G101/ENG/GRM155R71H104KE14-01.pdf?src-supplier=Avnet; ComponentLink4URL: http://search.murata.co.jp/Ceramy/image/img/A01X/G101/ENG/GRM155R71H104KE14-01.pdf?src-supplier=Avnet+Europe; ComponentLink4Description: http://search.murata.co.jp/Ceramy/image/img/A01X/G101/ENG/GRM155R71H104KE14-01.pdf?src-supplier=Avnet+Europe; Supplier Part Number 1: 490-13342-1-ND
C38 C42 = GRM155R6YA105KE11D: Capacitor 1uF/35V 0402 - storage; Manufacturer_Name: Murata Electronics; Datasheet Link: https://search.murata.co.jp/Ceramy/image/img/A01X/G101/ENG/GRM155R6YA105KE11-01A.pdf; Height: 0.7mm; Manufacturer Part Number: GRM155R6YA105KE11D; Mouser Part Number: 81-GRM155R6YA105KE1D; Mouser Price/Stock: https://www.mouser.co.uk/ProductDetail/Murata-Electronics/GRM155R6YA105KE11D?qs=hNud%2FORuBR1Z%2F4J6kBsCGQ%3D%3D; Arrow Part Number: GRM155R6YA105KE11D; Arrow Price/Stock: https://www.arrow.com/en/products/grm155r6ya105ke11d/murata-manufacturing?region=europe
C39 C43 = GRM155R61A106ME11D: Capacitor 10uF 0402 - storage; Manufacturer_Name: Murata Electronics; Datasheet Link: https://search.murata.co.jp/Ceramy/image/img/A01X/G101/ENG/GRM155R61A106ME11-01A.pdf; Height: 0.33mm; Manufacturer Part Number: GRM155R61A106ME11D; Mouser Part Number: 81-GRM155R61A106ME1D; Mouser Price/Stock: https://www.mouser.co.uk/ProductDetail/Murata-Electronics/GRM155R61A106ME11D?qs=xZ%2FP%252Ba9zWqZMJSi57Q8OyA%3D%3D; Arrow Part Number: GRM155R61A106ME11D; Arrow Price/Stock: https://www.arrow.com/en/products/grm155r61a106me11d/murata-manufacturing?utm_currency=USD&region=nac
C48 C49 = C0402C220K5GACTU: Capacitor 22pF 0402; Manufacturer_Name: KEMET; Datasheet Link: https://content.kemet.com/datasheets/KEM_C1002_X7R_SMD.pdf; Height: 0.55mm; Manufacturer Part Number: C0402C220K5GACTU; Mouser Part Number: 80-C0402C220K5G; Mouser Price/Stock: https://www.mouser.co.uk/ProductDetail/KEMET/C0402C220K5GACTU?qs=6dm3P68XlMDqaWSnHxY69A%3D%3D; Arrow Part Number: C0402C220K5GACTU; Arrow Price/Stock: https://www.arrow.com/en/products/c0402c220k5gactu/kemet-corporation?region=nac
C51 C52 = CMP-1035-02328-1: CAP 10nF 200V ±10% 0603 (1608 Metric) Thickness 1mm SMD; Manufacturer Part Number: C0603C103K2RAC; Manufacturer: Yageo Group; Case-Metric: 1608; Tolerance: Â±10%; Case-EIA: 0603; Technology: SMT; Rated Voltage: 200 V; Value: 10nF; Max Thickness: 1 mm
C54 = CL31B102KJHNNNE: as C81 on sheet USB_C_GNSS; Datasheet Link: https://www.tme.com/Document/4a42202b32dab16128fe107dd69598cc/samsung-chip-cap.pdf; Height: 1.8mm; Manufacturer Part Number: CL31B102KJHNNNE; Mouser Part Number: 187-CL31B102KJHNNNE; Mouser Price/Stock: https://www.mouser.co.uk/ProductDetail/Samsung-Electro-Mechanics/CL31B102KJHNNNE?qs=X6jEic%2FHinAYVHtIjHgytw%3D%3D; Arrow Part Number: CL31B102KJHNNNE; Arrow Price/Stock: https://www.arrow.com/en/products/cl31b102kjhnnne/samsung-electro-mechanics?utm_currency=USD&region=nac; Supplier 1: DigiKey; Supplier Part Number 1: 1276-3073-1-ND
FB1 FB2 = CMP-0686-00581-3: as FB5 on sheet USB_C_GNSS; Tolerance: 25%; Case Code (Metric): 1608; Width: 0.8mm; DC Current: 1.3A; Max DC Current: 1.3A; Package Quantity: 1; Number of Pins: 2; Military Standard: Not; RoHS Compliant: Yes; Termination: SMD/SMT; Max Operating Temperature: 125°C; Length: 1.6mm; Depth: 0.8mm; Case Code (Imperial): 0603; Series: BLM18K; Inductor Type: FERRITE BEAD; Core Material: Ferrite; Number of Circuits: 1; Height: 0.8mm; Case/Package: 0603; REACH SVHC: No SVHC; Packaging: Tape and Reel; Min Operating Temperature: -55°C; Max Current Rating: 1.3A; Radiation Hardening: No; Current Rating: 1.3A; Lead Free: Lead Free; Test Frequency: 100MHz; Weight: 7.1E-05oz; Manufacturer Part Number: BLM18KG601SN1D; Supplier 1: Digikey; Supplier Part Number 1: 490-5258-1-ND
R29-R31 R35 = CMP-2001-00613-1: Resistor 2k2 0603; Manufacturer: Panasonic; Manufacturer Part Number: ERA6AEB222V; Supplier 1: Mouser; Supplier Part Number 1: 603-RC0603FR-072K2L
R32 R33 = CMP-009-00183-1: Resistor 0R 0402; Manufacturer: Vishay Dale; Manufacturer Part Number: CRCW04020000Z0EDHP; Power: 200mW; Min Operating Temperature: -55°C; Pins: 2; Case/Package: 0402; Mounting Technology: Surface Mount; Max Operating Temperature: 155°C; RoHS Compliant: Yes; Component Type: Resistors; Supplier 1: Digikey; Supplier Part Number 1: 541-0.0YBCT-ND
  R32: Value: 0R
  R33: Value: DNP
R34 = CMP-2002-00186-1: Resistor 6k49 0402 1%; Manufacturer: Vishay Dale; Manufacturer Part Number: CRCW04026K49FKED; Supplier 1: Mouser; Supplier Part Number 1: 71-CRCW0402-6.49K-E3
R36 R37 = CMP-2001-00665-1: Resistor 75R 0805; Part Number: ERA6AEB750V; Manufacturer Part Number: ERA6AEB750V; Supplier 1: Mouser; Supplier Part Number 1: 667-ERA-6AEB750V
T1 = SM91072AL: Telecom Transformer 1: 1 1.4Ohm Prim. DCR 1Ohm Sec. DCR 16 Terminal Gull Wing SMD Automotive; Manufacturer: Bourns; Value: 350uH; Turns Ratio: 1:1; ComponentLink1URL: http://www.farnell.com/datasheets/2169310.pdf?src-supplier=Farnell; ComponentLink1Description: http://www.farnell.com/datasheets/2169310.pdf?src-supplier=Farnell; ComponentLink2URL: https://www.bourns.com/docs/Product-Datasheets/sm13072apel.pdf?src-supplier=Digi-Key; ComponentLink2Description: https://www.bourns.com/docs/Product-Datasheets/sm13072apel.pdf?src-supplier=Digi-Key; ComponentLink3URL: http://www.farnell.com/datasheets/2169310.pdf?src-supplier=Newark; ComponentLink3Description: http://www.farnell.com/datasheets/2169310.pdf?src-supplier=Newark; Supplier: Digikey; Supplier Part Number: 118-SM91072AL-ECT-ND; Manufacturer Part Number: SM91072AL; RoHS: Yes; Category: Uncategorized; Stock: 2173; Pricing: 1=4.72, 10=3.828, 25=3.0952, 50=2.8998, 100=2.7695, 250=2.68808 (USD); Mounting Technology: Surface Mount; Min Operating Temperature: -40°C; Max Operating Temperature: 125°C; Series: Automotive, AEC-Q200, SM; Supplier 1: Digikey; Supplier Part Number 1: 118-SM91072AL-ECT-ND
U4 = DP83826ERHBR: Ethernet Transceiver, 1-Trnsvr, PQCC32; Manufacturer: Texas Instruments; Supplier: Digikey; Supplier Part Number: 296-DP83826ERHBRCT-ND; Manufacturer Part Number: DP83826ERHBR; RoHS: Yes; Category: Ethernet Interface ICs; Stock: 2127; Pricing: 1=3.1, 10=2.321, 25=2.1264, 100=1.9128, 250=1.81096, 500=1.74958, 1000=1.69905 (USD); ComponentLink1URL: https://www.ti.com:443/lit/ds/symlink/dp83826e.pdf?src-supplier=IHS+Markit; ComponentLink1Description: https://www.ti.com:443/lit/ds/symlink/dp83826e.pdf?src-supplier=IHS+Markit; ComponentLink2URL: http://www.ti.com/general/docs/suppproductinfo.tsp?distId=10&amp;gotoUrl=http%3A%2F%2Fwww.ti.com%2Flit%2Fgpn%2Fdp83826e&src-supplier=Digikey; ComponentLink2Description: http://www.ti.com/general/docs/suppproductinfo.tsp?distId=10&amp;gotoUrl=http%3A%2F%2Fwww.ti.com%2Flit%2Fgpn%2Fdp83826e&src-supplier=Digikey; Supplier 1: Mouser; Supplier Part Number 1: 595-DP83826ERHBR; Supplier 2: Digikey; Supplier Part Number 2: 296-DP83826ERHBRCT-ND
U5 = CMP-04985-000004-1: TVS DIODE 5.5V 14V 10USON; Manufacturer: Texas Instruments; Direction: Unidirectional; Standoff Height: 0mm; Capacitance: 0.5pF; Number Of Channels: 4; Breakdown Voltage: 6.4V; Peak Pulse Power: 2.5W; Automotive Grade: Grade 1; Value: 0.5pF; Interface: USB,Ethernet,LVDS,Other; Peak Pulse Current: 2.5A; Operating Supply Voltage: 5.5V; Reverse Standoff Voltage: 5.5V; Package: DQA0010A; Temperature Range Low: -40°C; Temperature Range High: +125°C; Ambient Temperature Range Low: -40°C; Device Class L1: Circuit Protection; Clamping Voltage: 14V; Manufacturer Part Number: TPD4E05U06QDQARQ1; Device Class L2: ESD and Circuit Protection ICs; Octopart: https://octopart.com/tpd4e05u06qdqarq1-texas+instruments-48523459; Device Class L3: unset; Height: 0.55mm; Automotive: Yes; ComponentLink2Description: Datasheet; RoHS: TRUE; Ambient Temperature Range High: +125°C; Category: IC; Mouser Description: Automotive 4-Channel ESD Protection Solution for SuperSpeed (up to 5 Gbps) Interface 10-USON -40 to 125; Temperature: -40°C to +125°C; ComponentLink2URL: http://www.ti.com/lit/ds/symlink/tpd4e05u06-q1.pdf; Digikey Description: TVS DIODE 5.5V 14V 10USON; Lead Free: Yes
X1 = M12D-04PFFR-SF7003: Conn Circular F 4 POS Solder RA Panel Mount 4 Terminal 1 Port; Manufacturer: Amphenol; Manufacturer Part Number: M12D-04PFFR-SF7003; RoHS: No; Pricing 1: 10=8.15600 (USD); ComponentLink1URL: http://www.amphenolltw.com/2012download/2D%20PDF/03_M%20Series%20Sensor%20Connectors/M12D-04PFFR-SF7003.pdf?src-supplier=Digi-Key; ComponentLink1Description: http://www.amphenolltw.com/2012download/2D%20PDF/03_M%20Series%20Sensor%20Connectors/M12D-04PFFR-SF7003.pdf?src-supplier=Digi-Key; Supplier 1: Digikey; Supplier Part Number 1: 4995-M12D-04PFFR-SF7003-ND
Y2 = CMP-27762-004325-2: Crystal 25MHz ±20ppm (Tol) ±50ppm (Stability) 12pF FUND 50Ω Automotive 4-Pin Ultra Mini-CSMD T/R; ESR (Equivalent Series Resistance): 50R; Load Capacitance: 12pF; Ratings: AEC-Q200; Frequency: 25MHz; Packaging: Cut Tape; Frequency Stability: 50ppm; Series: ABM8AIG; RoHS Compliant: Yes; Height: 0.031inch; Width: 0.098inch; Mount: Surface Mount; Length: 0.126inch; Frequency Tolerance: 20ppm; Min Operating Temperature: -40°C; Case/Package: SMD/SMT; Max Operating Temperature: 125°C; Manufacturer Part Number: ABM8AIG-25.000MHZ-12-2Z-T3

## Sheet SENS_MEMS.SchDoc: Ublox GNSS Node
size A4; DocumentNumber: 3; SheetNumber: 3; SheetTotal: 12
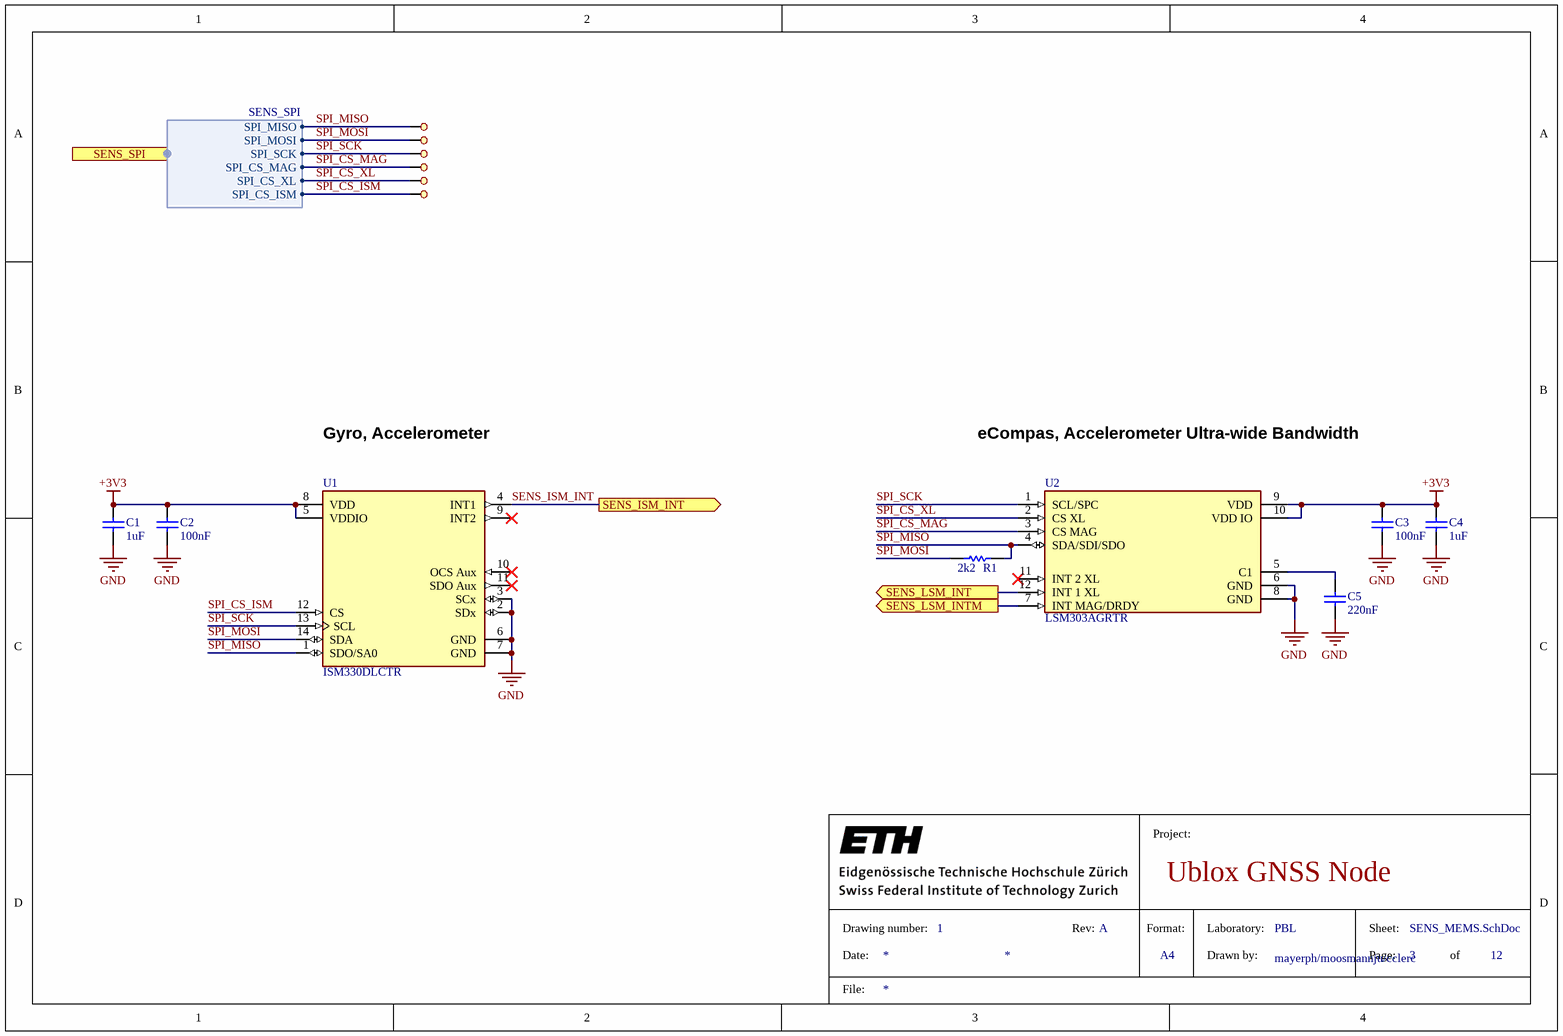
[diagram p7: SENS_MEMS.SchDoc]

### Parts
2  testpoint  [testpoint]  (value not drawn)
3  testpoint  [testpoint]  (value not drawn)
4  testpoint  [testpoint]  (value not drawn)
5  testpoint  [testpoint]  (value not drawn)
6  testpoint  [testpoint]  (value not drawn)
7  testpoint  [testpoint]  (value not drawn)
C1  1uF  [CAPC0402(1005)60_L]
C2  100nF  [CAPC1005X55X25LL05T10]
C3  100nF  [CAPC1005X55X25LL05T10]
C4  1uF  [CAPC0402(1005)60_L]
C5  220nF  [CAPC1005X55X25NL05T05]
R1  2k2  [RESC1005X40X25NL05T10]
U1  ISM330DLCTR  [FP-LGA-14L-DM00249496-MFG]
U2  LSM303AGRTR  [FP-LGA-12-8487206-MFG]

### Ports
SENS_ISM_INT (out, see MAIN[6A], MCU[1B]), SENS_LSM_INT (out, see MAIN[6A], MCU[1B]), SENS_LSM_INTM (out, see MAIN[6A], MCU[1B]), SENS_SPI (harness SENS_SPI, see MAIN[6A], MCU[1B])

### Harnesses
SENS_SPI: SPI_SCK, SPI_MOSI, SPI_MISO, SPI_CS_MAG, SPI_CS_ISM, SPI_CS_XL

### Nets
+3V3: C1.2 C2.2 C3.2 C4.2 U1.5(VDDIO) U1.8(VDD) U2.9(VDD) U2.10(VDD_IO)
GND: C1.1 C2.1 C3.1 C4.1 C5.1 U1.2(SDx) U1.3(SCx) U1.6(GND) U1.7(GND) U2.6(GND) U2.8(GND)
SENS_ISM_INT: U1.4(INT1) ; port SENS_ISM_INT
SENS_LSM_INT: U2.12(INT_1_XL) ; port SENS_LSM_INT
SENS_LSM_INTM: U2.7(INT_MAG/DRDY) ; port SENS_LSM_INTM
SPI_CS_ISM: 7.1 U1.12(CS) ; port SENS_SPI.SPI_CS_ISM
SPI_CS_MAG: 5.1 U2.3(CS_MAG) ; port SENS_SPI.SPI_CS_MAG
SPI_CS_XL: 6.1 U2.2(CS_XL) ; port SENS_SPI.SPI_CS_XL
SPI_MISO: 2.1 R1.2 U1.1(SDO/SA0) U2.4(SDA/SDI/SDO) ; port SENS_SPI.SPI_MISO
SPI_MOSI: 3.1 R1.1 U1.14(SDA) ; port SENS_SPI.SPI_MOSI
SPI_SCK: 4.1 U1.13(SCL) U2.1(SCL/SPC) ; port SENS_SPI.SPI_SCK
NetC5_2: C5.2 U2.5(C1)

Not connected (* = marked no-connect by the designer): U1 9(INT2)* 10(OCS_Aux)* 11(SDO_Aux)*; U2 11(INT_2_XL)*

### Notes on the sheet
- Gyro, Accelerometer
- eCompas, Accelerometer Ultra-wide Bandwidth
- Project:
- Drawing number:
- Date:
- 1
- Rev:
- Format:
- A4
- Laboratory:
- Drawn by:
- Sheet:
- Page:
- of
- File:

### Library data of the parts
C1 C4 = CMP-1034-02114-1: CAP 1uF  0402 (1005 Metric); Manufacturer: Murata; Manufacturer Part Number: GRM155C81C105KE11D; Voltage Rating: 16V; Tolerance: 10%; Dielectric: X6S; Supplier 1: Digi-Key; Supplier Part Number 1: 490-12700-1-ND; RoHS: Yes; Category: Ceramic Capacitors; Stock 1: 7199; Pricing 1: 1=0.29000, 10=0.19700, 50=0.11840, 100=0.09990, 500=0.06836, 1000=0.06047, 2500=0.05784, 5000=0.05258 (USD); Mount: Surface Mount; Case/Package: 0402; Case Code (Metric): 1005; Case Code (Imperial): 0402; Weight: 0.000212oz; Min Operating Temperature: -55°C; Max Operating Temperature: 105°C; Value: 1uF; Packaging: Tape and Reel; Termination: SMD/SMT; Package Quantity: 10000; Voltage Rating (DC): 16V; Resistor Type: Ceramic; Length: 0.039inch; Width: 0.5mm; Height: 0.5mm; Thickness: 0.024inch; RoHS Compliant: Yes; Lead Free: Lead Free; ComponentLink1URL: http://www.mouser.com/ds/2/281/c02e-2905.pdf?src-supplier=Mouser; ComponentLink1Description: http://www.mouser.com/ds/2/281/c02e-2905.pdf?src-supplier=Mouser; ComponentLink2URL: http://search.murata.co.jp/Ceramy/image/img/A01X/G101/ENG/GRM155C81C105KE11-01.pdf?src-supplier=Digi-Key; ComponentLink2Description: http://search.murata.co.jp/Ceramy/image/img/A01X/G101/ENG/GRM155C81C105KE11-01.pdf?src-supplier=Digi-Key
C2 C3 = CMP-2008-03928-1: Manufacturer: Murata; Part Number: GRM155R71C104KA88J; Tolerance: 10%; Value: 100nF; Manufacturer Part Number: GRM155R71C104KA88J
C5 = CMP-1034-02087-2: Manufacturer: Samsung; Manufacturer Part Number: CL05B224KO5NNNC; Material: 4241ConductorMaterial; Tolerance: 10%; Voltage Rating: 16V; Dielectric: X7R; ComponentLink1URL: https://datasheet.ciiva.com/25800/cl05b224ko5nnnc-25800450.pdf?src-supplier=Digikey; ComponentLink1Description: https://datasheet.ciiva.com/25800/cl05b224ko5nnnc-25800450.pdf?src-supplier=Digikey; Supplier: Digikey; Supplier Part Number: 1276-1176-1-ND; RoHS: Yes; Category: Ceramic Capacitors; Stock: 1519601; Pricing: 1=0.1, 10=0.028, 50=0.0164, 100=0.0126, 500=0.0095, 1000=0.00747, 2500=0.00679, 5000=0.00625 (USD); Mounting Technology: Surface Mount; Case/Package: 0402; Case Code (Metric): 1005; Case Code (Imperial): 0402; Min Operating Temperature: -55°C; Max Operating Temperature: 125°C; Packaging: Tape and Reel; Value: 220nF; Series: CL; Voltage Rating (DC): 16V; Construction: Flat; Length: 1mm; Height: 0.5mm; Depth: 0.5mm; Radiation Hardening: No; RoHS Compliant: Yes
R1 = CMP-2002-07567-1: Manufacturer: Yageo / Phycomp; Part Number: RC0402FR-072K2L
U1 = CMP-12177-000014-1: INEMO INERTIAL MODULE: ALWAYS-ON; Manufacturer: STMicroelectronics; Supplier: Digikey; Supplier Part Number: 497-19784-6-ND; Manufacturer Part Number: ISM330DLCTR; RoHS: Yes; Category: Inertial Measurement Units (IMUs); Stock: 20451; Pricing: 1=10.35, 10=8.282, 25=7.6608, 100=6.6256, 500=6.2115, 1000=5.7974 (USD); ComponentLink1URL: https://datasheet.octopart.com/ISM330DHCXTR-STMicroelectronics-datasheet-153441497.pdf?src-supplier=Element14; ComponentLink1Description: https://datasheet.octopart.com/ISM330DHCXTR-STMicroelectronics-datasheet-153441497.pdf?src-supplier=Element14; ComponentLink2URL: https://www.st.com/resource/en/datasheet/ism330dhcx.pdf?src-supplier=Digikey; ComponentLink2Description: https://www.st.com/resource/en/datasheet/ism330dhcx.pdf?src-supplier=Digikey; ComponentLink3URL: https://datasheet.octopart.com/ISM330DHCXTR-STMicroelectronics-datasheet-142139761.pdf?src-supplier=Future+Electronics; ComponentLink3Description: https://datasheet.octopart.com/ISM330DHCXTR-STMicroelectronics-datasheet-142139761.pdf?src-supplier=Future+Electronics
U2 = CMP-2000-07465-2: IMU ACCEL/MAG I2C/SPI 12LGA; Manufacturer: STMicroelectronics; Accel Range: 2/4/8/16g; Operating Supply Current: 3.7-200uA; Sensor Output: I2C,SPI; Accel Resolution: 16bits; Max Supply Voltage: 3.6V; Min Supply Voltage: 1.71V; Mag Sense Range: 49.152gauss (g); Sensor Type: Temperature,Accelerometer,Magnetometer; Mouser Description: IMUs - Inertial Measurement Units Ultra-compact high-performance e-compass 3D accelerometer and 3D magnetometer module; Temperature Range High: +85°C; Package: LGA-12-8487206; Manufacturer Part Number: LSM303AGRTR; Category: IC; Device Class L3: Inertial Measurement Units (IMUs); Temperature: -40°C to +85°C; Device Class L2: Motion Sensors; ComponentLink2Description: Datasheet; Octopart: https://octopart.com/lsm303agrtr-stmicroelectronics-59386630; Automotive: No; Device Class L1: Sensors; Resolution: 16bits; RoHS: TRUE; Height: 1mm; ComponentLink2URL: https://www.st.com/resource/en/datasheet/lsm303agr.pdf; Lead Free: Yes; Temperature Range Low: -40°C; Footprint Url: https://www.st.com/content/ccc/resource/technical/document/technical_note/73/17/9c/16/dd/96/4a/01/CD00134799.pdf/files/CD00134799.pdf/jcr:content/translations/en.CD00134799.pdf; Digikey Description: IMU ACCEL/MAG I2C/SPI 12LGA

## Sheet DCDC_Converters.SchDoc: Ublox GNSS Node
size A4; DocumentNumber: 7; SheetNumber: 7; SheetTotal: 12
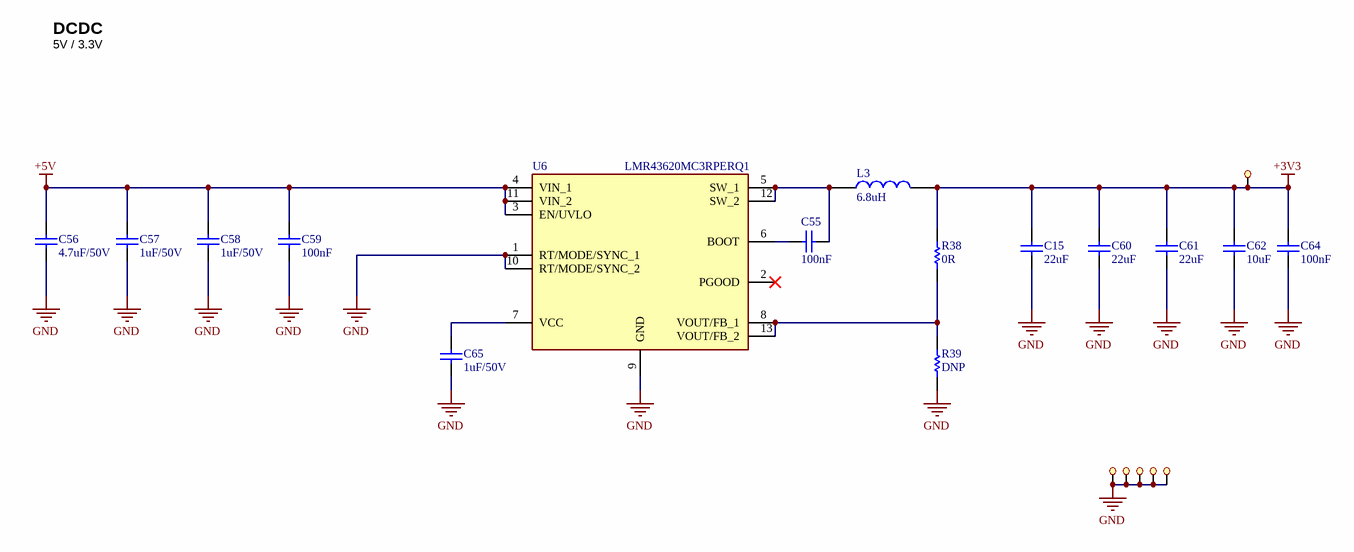
[diagram p8: DCDC_Converters.SchDoc]

### Parts
*13  testpoint  [testpoint]  (value not drawn)
*14  testpoint  [testpoint]  (value not drawn)
*15  testpoint  [testpoint]  (value not drawn)
*16  testpoint  [testpoint]  (value not drawn)
*17  testpoint  [testpoint]  (value not drawn)
*18  testpoint  [testpoint]  (value not drawn)
C15  22uF  [CAPC2013X152X50ML20T25]
C55  100nF  [CAPC1005X55X25ML05T10]
C56  4.7uF/50V  [CAPC2012X145N]
C57  1uF/50V  [CAPC3216X110X50LL20T25]
C58  1uF/50V  [CAPC3216X110X50LL20T25]
C59  100nF  [CAPC1005X55X25ML05T10]
C60  22uF  [CAPC2013X152X50ML20T25]
C61  22uF  [CAPC2013X152X50ML20T25]
C62  10uF  [FP-GRM188-0_2-IPC_C]
C64  100nF  [CAPC1005X55X25ML05T10]
C65  1uF/50V  [CAPC3216X110X50LL20T25]
L3  6.8uH  [DR736R8R]
R38  0R  [RESC1005X40X25LL05T10]
R39  DNP  [RESC1005X40X25LL05T10]
U6  LMR43620MC3RPERQ1  [LMR43620MC3RPERQ1]

### Nets
+3V3: *13.1 C15.2 C60.2 C61.2 C62.2 C64.2 L3.2 R38.2
+5V: C56.2 C57.2 C58.2 C59.1 U6.3(EN/UVLO) U6.4(VIN_1) U6.11(VIN_2)
GND: *14.1 *15.1 *16.1 *17.1 *18.1 C15.1 C56.1 C57.1 C58.1 C59.2 C60.1 C61.1 C62.1 C64.1 C65.1 R39.1 U6.1(RT/MODE/SYNC_1) U6.9(GND) U6.10(RT/MODE/SYNC_2)
NetC55_1: C55.1 L3.1 U6.5(SW_1) U6.12(SW_2)
NetC55_2: C55.2 U6.6(BOOT)
NetC65_2: C65.2 U6.7(VCC)
NetR38_1: R38.1 R39.2 U6.8(VOUT/FB_1) U6.13(VOUT/FB_2)

Not connected (* = marked no-connect by the designer): U6 2(PGOOD)*

### Notes on the sheet
- DCDC
- 5V / 3.3V
- Project:
- Drawing number:
- Date:
- 1
- Rev:
- Format:
- A4
- Laboratory:
- Drawn by:
- Sheet:
- Page:
- of
- File:

### Library data of the parts
C15 C60 C61 = CMP-2007-04522-1: Manufacturer: AVX Interconnect / Elco; Part Number: 0805ZD226MAT2A
C55 C59 C64 = GRM155R71H104KE14J: as C37 on sheet ETH; Supplier 1: Digi-Key; Manufacturer Part Number: GRM155R71H104KE14J; RoHS: Yes; Category: Ceramic Capacitors; Stock 1: 1916144; Pricing 1: 1=0.10000, 10=0.03800, 100=0.01680, 500=0.01198, 1000=0.00941, 2500=0.00855, 5000=0.00787 (USD); Mount: Surface Mount; Case/Package: 0402; Weight: 0.000212oz; Case Code (Imperial): 0402; Case Code (Metric): 1005; Min Operating Temperature: -55°C; Max Operating Temperature: 125°C; Termination: SMD/SMT; Composition: Ceramic; Package Quantity: 50000; Packaging: Tape and Reel; Value: 100nF; Voltage Rating: 50V; Length: 0.039inch; Height: 0.5mm; Width: 0.5mm; Thickness: 0.022inch; Lead Free: Lead Free; ComponentLink1URL: http://search.murata.co.jp/Ceramy/image/img/A01X/G101/ENG/GRM155R71H104KE14-01.pdf?src-supplier=Mouser; ComponentLink1Description: http://search.murata.co.jp/Ceramy/image/img/A01X/G101/ENG/GRM155R71H104KE14-01.pdf?src-supplier=Mouser; ComponentLink2URL: http://search.murata.co.jp/Ceramy/image/img/A01X/G101/ENG/GRM155R71H104KE14-01.pdf?src-supplier=Digi-Key; ComponentLink2Description: http://search.murata.co.jp/Ceramy/image/img/A01X/G101/ENG/GRM155R71H104KE14-01.pdf?src-supplier=Digi-Key; ComponentLink3URL: http://search.murata.co.jp/Ceramy/image/img/A01X/G101/ENG/GRM155R71H104KE14-01.pdf?src-supplier=Avnet; ComponentLink3Description: http://search.murata.co.jp/Ceramy/image/img/A01X/G101/ENG/GRM155R71H104KE14-01.pdf?src-supplier=Avnet; ComponentLink4URL: http://search.murata.co.jp/Ceramy/image/img/A01X/G101/ENG/GRM155R71H104KE14-01.pdf?src-supplier=Avnet+Europe; ComponentLink4Description: http://search.murata.co.jp/Ceramy/image/img/A01X/G101/ENG/GRM155R71H104KE14-01.pdf?src-supplier=Avnet+Europe; Supplier Part Number 1: 490-13342-1-ND
C56 = GRM21BR61H475KE51L: Capacitor 4.7uF/50V 0805; Manufacturer_Name: Murata Electronics; Datasheet Link: https://search.murata.co.jp/Ceramy/image/img/A01X/G101/ENG/GRM21BR61H475KE51-01A.pdf; Height: 1.45mm; Manufacturer Part Number: GRM21BR61H475KE51L; Mouser Part Number: 81-GRM21BR61H475KE1L; Mouser Price/Stock: https://www.mouser.co.uk/ProductDetail/Murata-Electronics/GRM21BR61H475KE51L?qs=eeBpzGFlv%252B%252BOtLzDC1PY6Q%3D%3D; Arrow Part Number: GRM21BR61H475KE51L; Arrow Price/Stock: https://www.arrow.com/en/products/grm21br61h475ke51l/murata-manufacturing?region=nac
C57 C58 C65 = CMP-2000-06011-1: Capacitor 1uF/50V 0801; Manufacturer: Kemet; Manufacturer Part Number: C1206C105K5RACTU; Case Height: 1mm; Dielectric: X7R; Voltage Rating: 50V; Temperature Coefficient / Code: +/-15%; Case Length: 3.2mm; Case Width: 1.6mm; Type: SMDMLCCX7R6.3-250VDCCommericalGrade; Tolerance: 10%; Class: Class1; Capacitance - nF: 1000nF; Capacitance: 1uF; Datasheet URL: http://www.kemet.com/docfinder?Partnumber=C1206C105K5RACTU; Product Category: MultilayerCeramicCapacitorsMLCC-SMD/SMT; Termination Style: SMD/SMT; Dimensions: 1.6mmWx3.2mmLx1mmH; Voltage Rating DC: 50V; Datasheet Version: 02/2016; Packaging: Reel; Brand: Kemet; RoHS: Details; Minimum Operating Temperature: -55C; Operating Temperature Range: -55Cto+125C; Package Reference: 1206; Manufacturer URL: http://www.kemet.com/; Product: GeneralTypeMLCCs; Package Description: 2-Pin Surface Mount Device, Body 3.2 x 1.6 mm; Mounting Technology: SurfaceMount; Case Code - mm: 3216; Maximum Operating Temperature: +125C; Series: C1206C; Factory Pack Quantity: 2500; Package / Case: 1206(3216metric); Case Code - in: 1206; Parameter 2: *; Parameter 3: *; Supplier 1: DigiKey; Supplier Part Number 1: 399-C1206C105K5RACTUTR-ND
C62 = GRM188R61E106MA73D: CAP CER 10UF 25V X5R 0603; Manufacturer: Murata; Tolerance: 20%; Supplier: Digi-Key; Supplier Part Number: 490-7202-6-ND; Manufacturer Part Number: GRM188R61E106MA73D; RoHS: Yes; Category: Ceramic Capacitors; Stock: 3353344; Pricing: 1=0.26, 10=0.176, 50=0.1176, 100=0.0999, 500=0.07054, 1000=0.06173 (USD); ComponentLink1URL: https://datasheet.ciiva.com/14906/partnumbering-e-01-14906429.pdf?src-supplier=Digi-Key; ComponentLink1Description: https://datasheet.ciiva.com/14906/partnumbering-e-01-14906429.pdf?src-supplier=Digi-Key; ComponentLink2URL: https://datasheet.ciiva.com/14906/partnumbering-e-01-14906431.pdf?src-supplier=Digi-Key; ComponentLink2Description: https://datasheet.ciiva.com/14906/partnumbering-e-01-14906431.pdf?src-supplier=Digi-Key; ComponentLink3URL: https://datasheet.ciiva.com/22776/608985-22776426.pdf?src-supplier=Farnell; ComponentLink3Description: https://datasheet.ciiva.com/22776/608985-22776426.pdf?src-supplier=Farnell; ComponentLink4URL: https://datasheet.ciiva.com/22776/c02e-22776427.pdf?src-supplier=Farnell; ComponentLink4Description: https://datasheet.ciiva.com/22776/c02e-22776427.pdf?src-supplier=Farnell; ComponentLink5URL: https://datasheet.ciiva.com/22619/c02e-22619674.pdf?src-supplier=Element14; ComponentLink5Description: https://datasheet.ciiva.com/22619/c02e-22619674.pdf?src-supplier=Element14; Value: 10uF
L3 = DR73-6R8-R: Inductor 6.8uH 2.55A 43.5 MOHM; Manufacturer_Name: Eaton; Datasheet Link: https://www.eaton.com/content/dam/eaton/products/electronic-components/resources/data-sheet/eaton-dr-high-power-density-high-efficiency-shielded-drum-core-power-inductors-data-sheet.pdf; Height: 3.55mm; Manufacturer Part Number: DR73-6R8-R; Mouser Part Number: 704-DR73-6R8-R; Mouser Price/Stock: https://www.mouser.co.uk/ProductDetail/Eaton-Electronics/DR73-6R8-R?qs=yzwxPInThYRgvP%252Bo5UKn2A%3D%3D; Arrow Part Number: DR73-6R8-R; Arrow Price/Stock: https://www.arrow.com/en/products/dr73-6r8-r/eaton?utm_currency=USD&region=nac
R38 R39 = CMP-2002-03041-1: Resistor 0R 0402; Part Number: CRCW04020000Z0EDHP; Manufacturer: Vishay Dale; Value: 0Ohm; Voltage Rating: 50V; Power Rating: 200mW; Temperature Coefficient: 0ppm/°C; Max Power Dissipation: 125mW; Supplier 1: Digi-Key; Supplier Part Number 1: 541-0.0YBCT-ND; Manufacturer Part Number: CRCW04020000Z0EDHP; RoHS: Yes; Category: Chip SMD Resistors; Stock 1: 527407; Pricing 1: 1=0.13000, 10=0.11300, 25=0.07840, 50=0.06080, 100=0.04350, 250=0.03388, 500=0.02694, 1000=0.01912, 5000=0.01477 (USD); Mount: Surface Mount; Case/Package: 0402; Weight: 2.3E-05oz; Case Code (Metric): 1005; Case Code (Imperial): 0402; Contact Plating: Tin; Min Operating Temperature: -55°C; Max Operating Temperature: 155°C; Packaging: Tape and Reel; Composition: Thick Film; Termination: SMD/SMT; Voltage Rating (DC): 50V; Package Quantity: 1; Military Standard: Not; Number of Terminations: 2; Features: Automotive AEC-Q200; Length: 1mm; Height: 0.3mm; Width: 0.02inch; Depth: 0.5mm; Radiation Hardening: No; REACH SVHC: Unknown; Lead Free: Lead Free; ComponentLink1URL: https://datasheet.ciiva.com/16494/crcwhpe3-16494453.pdf?src-supplier=Future+Electronics; ComponentLink1Description: https://datasheet.ciiva.com/16494/crcwhpe3-16494453.pdf?src-supplier=Future+Electronics; ComponentLink2URL: https://datasheet.ciiva.com/2470/crcwhpe3-2470555.pdf?src-supplier=Digi-Key; ComponentLink2Description: https://datasheet.ciiva.com/2470/crcwhpe3-2470555.pdf?src-supplier=Digi-Key; ComponentLink3URL: https://datasheet.ciiva.com/5562/crcwhpe3-46056-5562315.pdf?src-supplier=Mouser; ComponentLink3Description: https://datasheet.ciiva.com/5562/crcwhpe3-46056-5562315.pdf?src-supplier=Mouser; ComponentLink4URL: https://datasheet.ciiva.com/9109/crcwhpe3-9109963.pdf?src-supplier=Avnet; ComponentLink4Description: https://datasheet.ciiva.com/9109/crcwhpe3-9109963.pdf?src-supplier=Avnet; ComponentLink5URL: https://datasheet.ciiva.com/2470/crcwhpe3-2470556.pdf?src-supplier=Digi-Key; ComponentLink5Description: https://datasheet.ciiva.com/2470/crcwhpe3-2470556.pdf?src-supplier=Digi-Key; ComponentLink6URL: https://datasheet.ciiva.com/28621/1912814-28621324.pdf?src-supplier=Element14; ComponentLink6Description: https://datasheet.ciiva.com/28621/1912814-28621324.pdf?src-supplier=Element14; ComponentLink7URL: https://datasheet.ciiva.com/2470/crcwhpe3-2470557.pdf?src-supplier=Digi-Key; ComponentLink7Description: https://datasheet.ciiva.com/2470/crcwhpe3-2470557.pdf?src-supplier=Digi-Key; ComponentLink8URL: https://datasheet.ciiva.com/7725/crcwhpe3-7725758.pdf?src-supplier=Element14; ComponentLink8Description: https://datasheet.ciiva.com/7725/crcwhpe3-7725758.pdf?src-supplier=Element14
U6 = LMR43620MC3RPERQ1: Integrated Circuit; Manufacturer_Name: Texas Instruments; Datasheet Link: https://www.ti.com/lit/ds/symlink/lmr43610-q1.pdf; Height: 1mm; Manufacturer Part Number: LMR43620MC3RPERQ1